# Altium schematic sheet Mcu.SchDoc
size A4; SheetNumber: 4; SheetTotal: 6
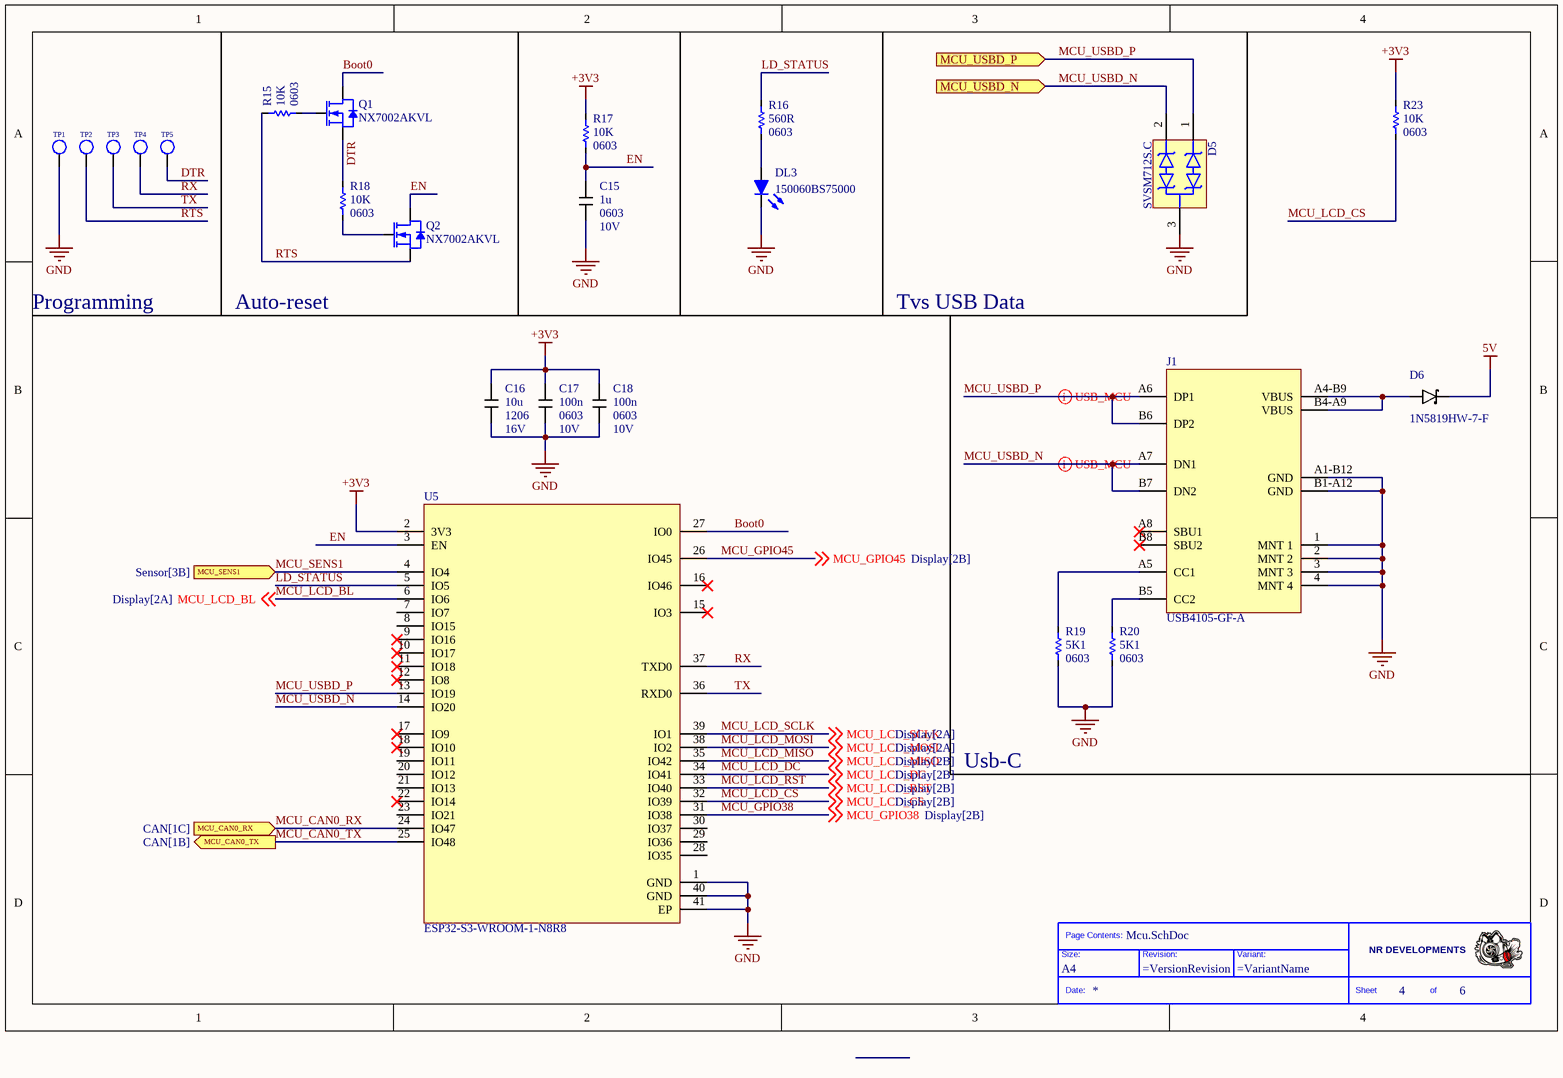
[diagram p0: Mcu.SchDoc]

## Parts
*?  Size: A4  (hidden comment: Title_Block)  (graphical)
C15  value 1u  Case: 0603  Voltage: 10V  [CAPC1608X09M]  (hidden comment: C0603C105K8RACTU)
C16  value 10u  Case: 1206  Voltage: 16V  [CAPC3216X16M]  (hidden comment: GCJ31CR71A106MA13L)
C17  value 100n  Case: 0603  Voltage: 10V  [CAPC1608X09M]  (hidden comment: C0603C104K5RACTU)
C18  value 100n  Case: 0603  Voltage: 10V  [CAPC1608X09M]  (hidden comment: C0603C104K5RACTU)
D5  value SVSM712S.C  [SOT95P240X120-3N]  (hidden comment: SM712-02HTG)
D6  value 1N5819HW-7-F  [SODFL360X130-2M -AC]  (hidden comment: Diode_Schottky)
DL3  150060BS75000  [LED0603]
J1  USB4105-GF-A  [GCT-USB4105-GF-A]
Q1  value NX7002AKVL  [SOT95P240X120-3N - GDS]  (hidden comment: BVSS138LT1G)
Q2  value NX7002AKVL  [SOT95P240X120-3N - GDS]  (hidden comment: BVSS138LT1G)
R15  value 10K  Case: 0603  [RESC1608X06M]  (hidden comment: CRCW060310K0FKEA)
R16  value 560R  Case: 0603  [RESC1608X06M]  (hidden comment: RC0603FR-07560RL)
R17  value 10K  Case: 0603  [RESC1608X06M]  (hidden comment: CRCW060310K0FKEA)
R18  value 10K  Case: 0603  [RESC1608X06M]  (hidden comment: CRCW060310K0FKEA)
R19  value 5K1  Case: 0603  [RESC1608X06M]  (hidden comment: Resistor)
R20  value 5K1  Case: 0603  [RESC1608X06M]  (hidden comment: Resistor)
R23  value 10K  Case: 0603  [RESC1608X06M]  (hidden comment: CRCW060310K0FKEA)
TP1  Test_Point  [TP_c200]  (value not drawn)
TP2  Test_Point  [TP_c200]  (value not drawn)
TP3  Test_Point  [TP_c200]  (value not drawn)
TP4  Test_Point  [TP_c200]  (value not drawn)
TP5  Test_Point  [TP_c200]  (value not drawn)
U5  value ESP32-S3-WROOM-1-N8R8  [ESPRESSIF_ESP32-S3-WROOM-1-N]  (hidden comment: ESP32-S3-WROOM-1-N)

## Ports
MCU_CAN0_RX (in, see CAN[1C]), MCU_CAN0_TX (out, see CAN[1B]), MCU_SENS1 (in, see Sensor[3B]), MCU_USBD_N (in), MCU_USBD_P (in)

## Nets
5V: D6.C
+3V3: C16.1 C17.1 C18.1 R17.2 R23.2 U5.2(3V3)
GND: C15.2 C16.2 C17.2 C18.2 D5.3 DL3.C J1.1(MNT_1) J1.2(MNT_2) J1.3(MNT_3) J1.4(MNT_4) J1.A1-B12(GND) J1.B1-A12(GND) R19.1 R20.1 TP1.1 U5.1(GND) U5.40(GND) U5.41(EP)
Boot0: Q1.D U5.27(IO0)
DTR: Q1.S R18.2 TP5.1
EN: C15.1 Q2.D R17.1 U5.3(EN)
LD_STATUS: R16.2 U5.5(IO5)
MCU_CAN0_RX: U5.24(IO47) ; port MCU_CAN0_RX
MCU_CAN0_TX: U5.25(IO48) ; port MCU_CAN0_TX
MCU_GPIO38: U5.31(IO38) ; off-sheet MCU_GPIO38
MCU_GPIO45: U5.26(IO45) ; off-sheet MCU_GPIO45
MCU_LCD_BL: U5.6(IO6) ; off-sheet MCU_LCD_BL
MCU_LCD_CS: R23.1 U5.32(IO39) ; off-sheet MCU_LCD_CS
MCU_LCD_DC: U5.34(IO41) ; off-sheet MCU_LCD_DC
MCU_LCD_MISO: U5.35(IO42) ; off-sheet MCU_LCD_MISO
MCU_LCD_MOSI: U5.38(IO2) ; off-sheet MCU_LCD_MOSI
MCU_LCD_RST: U5.33(IO40) ; off-sheet MCU_LCD_RST
MCU_LCD_SCLK: U5.39(IO1) ; off-sheet MCU_LCD_SCLK
MCU_SENS1: U5.4(IO4) ; port MCU_SENS1
MCU_USBD_N: D5.2 J1.A7(DN1) J1.B7(DN2) U5.14(IO20) ; port MCU_USBD_N
MCU_USBD_P: D5.1 J1.A6(DP1) J1.B6(DP2) U5.13(IO19) ; port MCU_USBD_P
RTS: Q2.S R15.2 TP2.1
RX: TP4.1 U5.37(TXD0)
TX: TP3.1 U5.36(RXD0)
NetD6_A: D6.A J1.A4-B9(VBUS) J1.B4-A9(VBUS)
NetDL3_A: DL3.A R16.1
NetJ1_A5: J1.A5(CC1) R19.2
NetJ1_B5: J1.B5(CC2) R20.2
NetQ1_G: Q1.G R15.1
NetQ2_G: Q2.G R18.1

Not connected (* = marked no-connect by the designer): J1 A8(SBU1)* B8(SBU2)*; U5 7(IO7) 8(IO15_) 9(IO16)* 10(IO17)* 11(IO18)* 12(IO8)* 15(IO3)* 16(IO46)* 17(IO9)* 18(IO10)* 19(IO11) 20(IO12) 21(IO13) 22(IO14)* 23(IO21) 28(IO35) 29(IO36) 30(IO37)

## Layout directives
differential pair: MCU_USBD_N, MCU_USBD_P

## Notes on the sheet
- Programming
- Auto-reset
- Tvs USB Data
- Usb-C
- (in symbol Title_Block) Page Contents:; NR DEVELOPMENTS; Size:; Revision:; Variant:; Date:; Sheet; of

## Library data of the parts
C15 C17 C18 = CAP: Manufacturer: KEMET; SMD/PTH: SMD
  C15: PartNumber: C0603C105K8RACTU
  C17 C18: PartNumber: C0603C104K5RACTU
C16 = CAP: Manufacturer: KEMET; PartNumber: C1206C106K4RAC7800; SMD/PTH: SMD
D5 = SM712-02HTG: ESD Diode bid -7 to 12v; Manufacturer: Semtech; PartNumber: SVSM712S.C; Case: SOT23-3
D6 = Diode_Schottky: Manufacturer: Diodes Incorporated; PartNumber: 1N5819HW-7-F; Case: SOD123
DL3 = LED_Blue: Manufacturer: Wurth Elektronik; SMD/PTH: SMD; Value: 150060BS75000; Case: 0603; PartNumber: 150060BS75000
J1 = USB4105-GF-A: USB Connectors USB Type C,2.0, Rec,SMT, 0.95mmTH Shell Stakes,G/F,RA,Top Mnt,T&R; Manufacturer: GCT; PartNumber: USB4105-GF-A; Value: USB4105-GF-A; Case: USB-C
Q1 Q2 = TRAN_NMOS_3P: Manufacturer: Nexperia; SMD/PTH: SMD; Case: SOT23-3; PartNumber: NX7002AKVL
R15 R17 R18 R23 = Resistor: Manufacturer: Vishay; SMD/PTH: SMD; PartNumber: CRCW060310K0FKEA
R16 = Resistor: Manufacturer: Vishay; PartNumber: CRCW0603560RJNEAC; SMD/PTH: SMD
R19 R20 = Resistor: Manufacturer: Vishay; PartNumber: CRCW06035K10FKEC
TP1-TP5 = Test_Point: Test Poin
U5 = ESP32-S3-WROOM-1-N: ESP32 S3 WROOM 1; Manufacturer: Espressif Systems; SMD/PTH: SMD; PartNumber: ESP32-S3-WROOM-1-N8R8